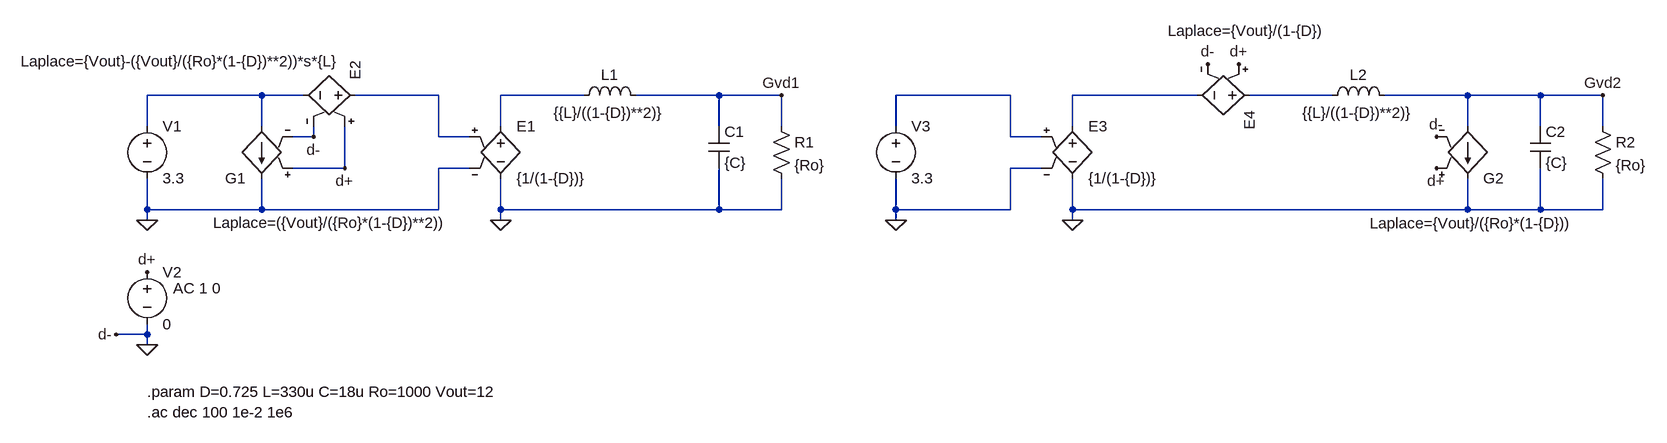
[diagram p0: schematic FDT Gvd open loop.asc]
FDT Gvd open loop.asc, the LTspice schematic file:
Version 4.1
SHEET 1 2296 680
WIRE 96 -688 -80 -688
WIRE 160 -688 96 -688
WIRE 368 -688 240 -688
WIRE 592 -688 464 -688
WIRE 800 -688 672 -688
WIRE 896 -688 800 -688
WIRE 1248 -688 1072 -688
WIRE 1536 -688 1344 -688
WIRE 1744 -688 1616 -688
WIRE 1952 -688 1824 -688
WIRE 2064 -688 1952 -688
WIRE 2160 -688 2064 -688
WIRE -80 -640 -80 -688
WIRE 96 -640 96 -688
WIRE 464 -640 464 -688
WIRE 800 -640 800 -688
WIRE 896 -640 896 -688
WIRE 1072 -640 1072 -688
WIRE 1344 -640 1344 -688
WIRE 1952 -640 1952 -688
WIRE 2064 -640 2064 -688
WIRE 2160 -640 2160 -688
WIRE 176 -624 176 -640
WIRE 176 -624 144 -624
WIRE 368 -624 368 -688
WIRE 416 -624 368 -624
WIRE 1248 -624 1248 -688
WIRE 1296 -624 1248 -624
WIRE 224 -576 224 -640
WIRE 224 -576 144 -576
WIRE 416 -576 368 -576
WIRE 1296 -576 1248 -576
WIRE -80 -512 -80 -560
WIRE 96 -512 96 -560
WIRE 96 -512 -80 -512
WIRE 368 -512 368 -576
WIRE 368 -512 96 -512
WIRE 464 -512 464 -560
WIRE 800 -512 800 -576
WIRE 800 -512 464 -512
WIRE 896 -512 896 -560
WIRE 896 -512 800 -512
WIRE 1072 -512 1072 -560
WIRE 1248 -512 1248 -576
WIRE 1248 -512 1072 -512
WIRE 1344 -512 1344 -560
WIRE 1952 -512 1952 -560
WIRE 1952 -512 1344 -512
WIRE 2064 -512 2064 -576
WIRE 2064 -512 1952 -512
WIRE 2160 -512 2160 -560
WIRE 2160 -512 2064 -512
WIRE -80 -496 -80 -512
WIRE 464 -496 464 -512
WIRE 1072 -496 1072 -512
WIRE 1344 -496 1344 -512
WIRE -80 -320 -80 -336
WIRE -80 -320 -128 -320
WIRE -80 -304 -80 -320
FLAG -80 -496 0
FLAG 464 -496 0
FLAG 224 -576 d+
FLAG 176 -624 d-
FLAG -80 -416 d+
FLAG -128 -320 d-
FLAG -80 -304 0
FLAG 896 -688 Gvd1
FLAG 1072 -496 0
FLAG 1344 -496 0
FLAG 2160 -688 Gvd2
FLAG 1600 -736 d+
FLAG 1904 -576 d+
FLAG 1904 -624 d-
FLAG 1552 -736 d-
SYMBOL voltage -80 -656 R0
WINDOW 123 0 0 Left 0
WINDOW 39 0 0 Left 0
SYMATTR InstName V1
SYMATTR Value 3.3
SYMBOL ind 576 -672 R270
WINDOW 0 32 56 VTop 2
WINDOW 3 5 56 VBottom 2
SYMATTR InstName L1
SYMATTR Value {{L}/((1-{D})**2)}
SYMBOL cap 784 -640 R0
SYMATTR InstName C1
SYMATTR Value {C}
SYMBOL res 880 -656 R0
SYMATTR InstName R1
SYMATTR Value {Ro}
SYMBOL e 464 -656 R0
SYMATTR InstName E1
SYMATTR Value {1/(1-{D})}
SYMBOL e 256 -688 M270
WINDOW 3 52 32 VRight 2
SYMATTR InstName E2
SYMATTR Value Laplace={Vout}-({Vout}/({Ro}*(1-{D})**2))*s*{L}
SYMBOL g 96 -544 R180
WINDOW 3 -290 -52 Left 2
SYMATTR InstName G1
SYMATTR Value Laplace=({Vout}/({Ro}*(1-{D})**2))
SYMBOL voltage -80 -432 R0
WINDOW 123 40 41 Left 2
WINDOW 39 0 0 Left 0
SYMATTR InstName V2
SYMATTR Value 0
SYMATTR Value2 AC 1 0
SYMBOL voltage 1072 -656 R0
WINDOW 123 0 0 Left 0
WINDOW 39 0 0 Left 0
SYMATTR InstName V3
SYMATTR Value 3.3
SYMBOL ind 1728 -672 R270
WINDOW 0 32 56 VTop 2
WINDOW 3 5 56 VBottom 2
SYMATTR InstName L2
SYMATTR Value {{L}/((1-{D})**2)}
SYMBOL cap 2048 -640 R0
SYMATTR InstName C2
SYMATTR Value {C}
SYMBOL res 2144 -656 R0
SYMATTR InstName R2
SYMATTR Value {Ro}
SYMBOL e 1344 -656 R0
SYMATTR InstName E3
SYMATTR Value {1/(1-{D})}
SYMBOL e 1632 -688 R90
WINDOW 3 -99 -102 VRight 2
SYMATTR InstName E4
SYMATTR Value Laplace={Vout}/(1-{D})
SYMBOL g 1952 -544 M180
WINDOW 3 -151 -53 Left 2
SYMATTR InstName G2
SYMATTR Value Laplace={Vout}/({Ro}*(1-{D}))
TEXT -80 -232 Left 2 !.param D=0.725 L=330u C=18u Ro=1000 Vout=12
TEXT -80 -200 Left 2 !.ac dec 100 1e-2 1e6

The netlist it stands for:
* FDT Gvd open loop.asc
V1 N001 0 3.3
L1 N003 Gvd1 {{L}/((1-{D})**2)}
C1 Gvd1 0 {C}
R1 Gvd1 0 {Ro}
E1 N003 0 N002 0 {1/(1-{D})}
E2 N002 N001 d+ 0 Laplace={Vout}-({Vout}/({Ro}*(1-{D})**2))*s*{L}
G1 N001 0 d+ 0 Laplace=({Vout}/({Ro}*(1-{D})**2))
V2 d+ 0 0 AC 1 0
V3 N004 0 3.3
L2 N006 Gvd2 {{L}/((1-{D})**2)}
C2 Gvd2 0 {C}
R2 Gvd2 0 {Ro}
E3 N005 0 N004 0 {1/(1-{D})}
E4 N006 N005 d+ 0 Laplace={Vout}/(1-{D})
G2 Gvd2 0 d+ 0 Laplace={Vout}/({Ro}*(1-{D}))
.param D=0.725 L=330u C=18u Ro=1000 Vout=12
.ac dec 100 1e-2 1e6
.backanno
.end